# Altium project Control V3.PrjPcb
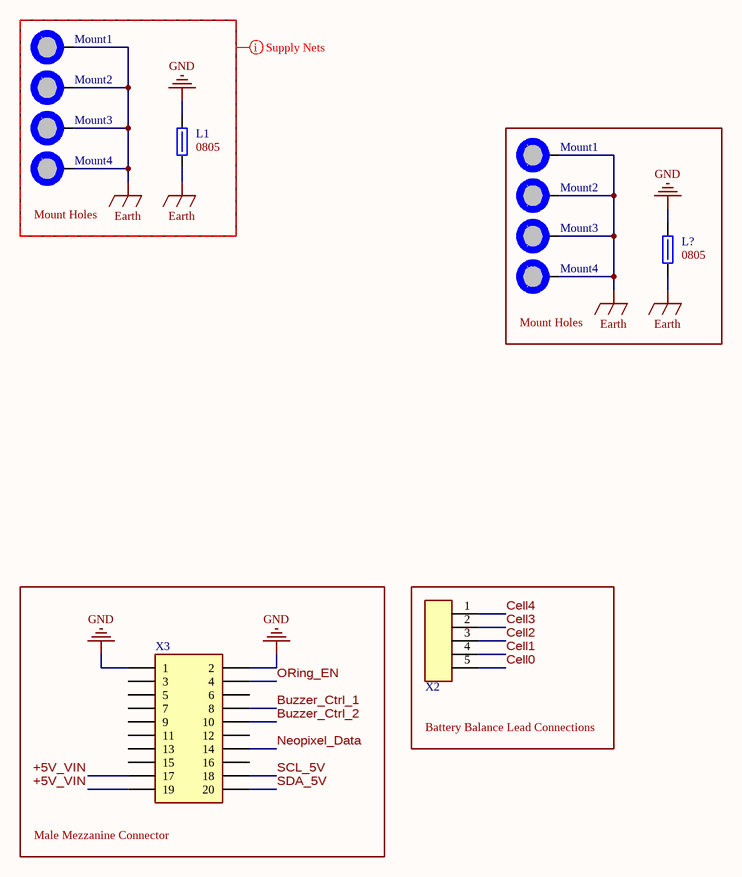
[diagram p0: Connections.SchDoc]
4 sheets, 85 parts. Net scope: global (net labels, ports and power ports of the same name join across sheets).
Board file: Layout.PcbDoc
Sheets:
  Connections.SchDoc
  RP2350.SchDoc
  Power.SchDoc
  Battery Monitor.SchDoc

## Sheet Connections.SchDoc
size A; SheetNumber: 1; SheetTotal: 4

### Parts
(Parts that share a designator on the sheet are numbered #1, #2 ... from top to bottom, then left to right.)
L1  Size Package: 0805  [[Ferrite] SMD 0805]  (hidden comment: 652-MH2029-300Y)
L?  Size Package: 0805  [[Ferrite] SMD 0805]  (hidden comment: 652-MH2029-300Y)
Mount1#1  M3 Mount Hole  [[Mount] M3 Mount Hole]  (value not drawn)  (no BOM)
Mount1#2  M3 Mount Hole  [[Mount] M3 Mount Hole]  (value not drawn)  (no BOM)
Mount2#1  M3 Mount Hole  [[Mount] M3 Mount Hole]  (value not drawn)  (no BOM)
Mount2#2  M3 Mount Hole  [[Mount] M3 Mount Hole]  (value not drawn)  (no BOM)
Mount3#1  M3 Mount Hole  [[Mount] M3 Mount Hole]  (value not drawn)  (no BOM)
Mount3#2  M3 Mount Hole  [[Mount] M3 Mount Hole]  (value not drawn)  (no BOM)
Mount4#1  M3 Mount Hole  [[Mount] M3 Mount Hole]  (value not drawn)  (no BOM)
Mount4#2  M3 Mount Hole  [[Mount] M3 Mount Hole]  (value not drawn)  (no BOM)
X2  [JST] 5pin 90deg 2.54mm pitch  [[JST] 5pin 90deg 2.54mm pitch]  (value not drawn)
X3  [Mezzanine] 20pin H=3.5mm Male  [[Mezzanine] 20pin H=3.5mm Male]  (value not drawn)

### Blocks framed on the sheet
Mount Holes: L1 Mount1#1 Mount2#1 Mount3#1 Mount4#1
Mount Holes: L? Mount1#2 Mount2#2 Mount3#2 Mount4#2
Male Mezzanine Connector: X3
Battery Balance Lead Connections: X2

### Nets
Earth: L1.1 L?.1 Mount1#1.1 Mount1#2.1 Mount2#1.1 Mount2#2.1 Mount3#1.1 Mount3#2.1 Mount4#1.1 Mount4#2.1
GND: L1.2 L?.2 X3.1 X3.2
+5V_VIN: X3.17 X3.19
Buzzer_Ctrl_1: X3.8
Buzzer_Ctrl_2: X3.10
Cell0: X2.5
Cell1: X2.4
Cell2: X2.3
Cell3: X2.2
Cell4: X2.1
Neopixel_Data: X3.14
ORing_EN: X3.4
SCL_5V: X3.18
SDA_5V: X3.20

Not connected (* = marked no-connect by the designer): X3 3 5 6 7 9 11 12 13 15 16

### Layout directives
net class Supply_Nets: Earth, GND

### Notes on the sheet
- (in symbol [Lug] 2pin M3 35A) M3; 35A

### Library data of the parts
L1 L? = [Ferrite] SMD 0805 3A 30ohm: Res @ Freq: 30 @ 100MHz; Supplier 1: DigiKey; Supplier Part Number 1: MH2029-300YCT-ND
Mount1#1 Mount1#2 Mount2#1 Mount2#2 Mount3#1 Mount3#2 Mount4#1 Mount4#2 = [Mount] M3 Mount Hole: Place at least 4.5mm from board edge. Plated.
X3 = [Mezzanine] 20pin H=3.5mm Male: DF40HC(3.5)-20DS-0.4V(51); System: Connector; Supplier 1: DigiKey; Supplier Part Number 1: 26-DF40HC(3.5)-20DS-0.4V(51)CT-ND

## Sheet RP2350.SchDoc
size B; SheetNumber: 2; SheetTotal: 4
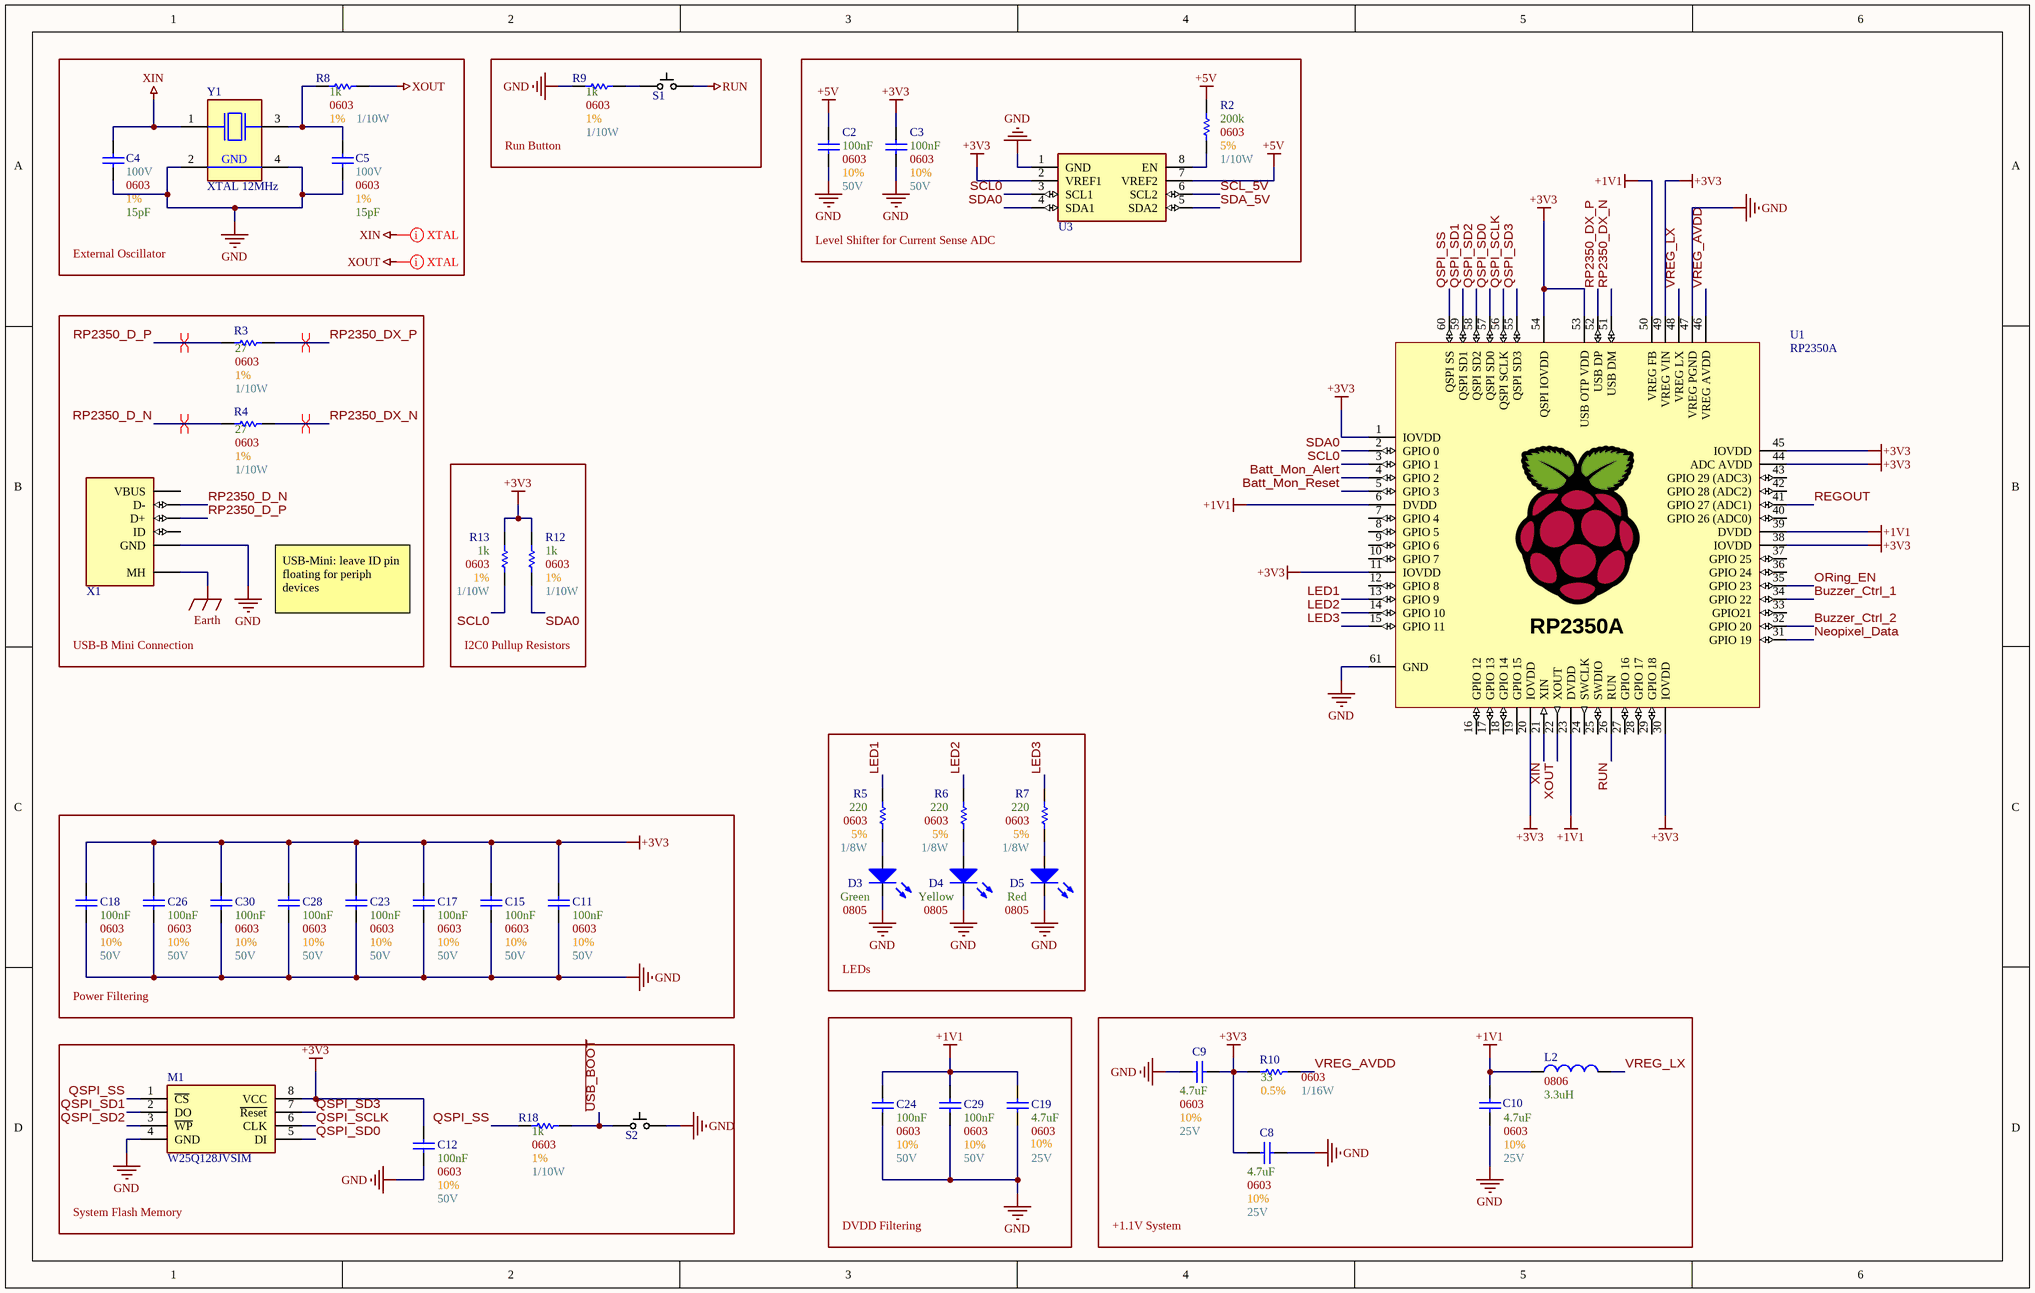
[diagram p1: RP2350.SchDoc]

### Parts
C2  Max Voltage: 50V  Size Package: 0603  Tolerance: 10%  Capacitance: 100nF  [[Cap] SMD 0603]  (hidden comment: [Cap] 0603 0.1uF 10% 50V)
C3  Max Voltage: 50V  Size Package: 0603  Tolerance: 10%  Capacitance: 100nF  [[Cap] SMD 0603]  (hidden comment: [Cap] 0603 0.1uF 10% 50V)
C4  Max Voltage: 100V  Size Package: 0603  Tolerance: 1%  Capacitance: 15pF  [[Cap] SMD 0603]  (hidden comment: [Cap] 0603 15pF 1% 100V)
C5  Max Voltage: 100V  Size Package: 0603  Tolerance: 1%  Capacitance: 15pF  [[Cap] SMD 0603]  (hidden comment: [Cap] 0603 15pF 1% 100V)
C8  Max Voltage: 25V  Size Package: 0603  Tolerance: 10%  Capacitance: 4.7uF  [[Cap] SMD 0603]  (hidden comment: [Cap] 0603 4.7uF 10% 25V)
C9  Max Voltage: 25V  Size Package: 0603  Tolerance: 10%  Capacitance: 4.7uF  [[Cap] SMD 0603]  (hidden comment: [Cap] 0603 4.7uF 10% 25V)
C10  Max Voltage: 25V  Size Package: 0603  Tolerance: 10%  Capacitance: 4.7uF  [[Cap] SMD 0603]  (hidden comment: [Cap] 0603 4.7uF 10% 25V)
C11  Max Voltage: 50V  Size Package: 0603  Tolerance: 10%  Capacitance: 100nF  [[Cap] SMD 0603]  (hidden comment: [Cap] 0603 0.1uF 10% 50V)
C12  Max Voltage: 50V  Size Package: 0603  Tolerance: 10%  Capacitance: 100nF  [[Cap] SMD 0603]  (hidden comment: [Cap] 0603 0.1uF 10% 50V)
C15  Max Voltage: 50V  Size Package: 0603  Tolerance: 10%  Capacitance: 100nF  [[Cap] SMD 0603]  (hidden comment: [Cap] 0603 0.1uF 10% 50V)
C17  Max Voltage: 50V  Size Package: 0603  Tolerance: 10%  Capacitance: 100nF  [[Cap] SMD 0603]  (hidden comment: [Cap] 0603 0.1uF 10% 50V)
C18  Max Voltage: 50V  Size Package: 0603  Tolerance: 10%  Capacitance: 100nF  [[Cap] SMD 0603]  (hidden comment: [Cap] 0603 0.1uF 10% 50V)
C19  Max Voltage: 25V  Size Package: 0603  Tolerance: 10%  Capacitance: 4.7uF  [[Cap] SMD 0603]  (hidden comment: [Cap] 0603 4.7uF 10% 25V)
C23  Max Voltage: 50V  Size Package: 0603  Tolerance: 10%  Capacitance: 100nF  [[Cap] SMD 0603]  (hidden comment: [Cap] 0603 0.1uF 10% 50V)
C24  Max Voltage: 50V  Size Package: 0603  Tolerance: 10%  Capacitance: 100nF  [[Cap] SMD 0603]  (hidden comment: [Cap] 0603 0.1uF 10% 50V)
C26  Max Voltage: 50V  Size Package: 0603  Tolerance: 10%  Capacitance: 100nF  [[Cap] SMD 0603]  (hidden comment: [Cap] 0603 0.1uF 10% 50V)
C28  Max Voltage: 50V  Size Package: 0603  Tolerance: 10%  Capacitance: 100nF  [[Cap] SMD 0603]  (hidden comment: [Cap] 0603 0.1uF 10% 50V)
C29  Max Voltage: 50V  Size Package: 0603  Tolerance: 10%  Capacitance: 100nF  [[Cap] SMD 0603]  (hidden comment: [Cap] 0603 0.1uF 10% 50V)
C30  Max Voltage: 50V  Size Package: 0603  Tolerance: 10%  Capacitance: 100nF  [[Cap] SMD 0603]  (hidden comment: [Cap] 0603 0.1uF 10% 50V)
D3  Color: Green  Size Package: 0805  [[LED] SMD 0805]  (hidden comment: [LED] SMD 0805 Green)
D4  Color: Yellow  Size Package: 0805  [[LED] SMD 0805]  (hidden comment: [LED] SMD 0805 Yellow)
D5  Color: Red  Size Package: 0805  [[LED] SMD 0805]  (hidden comment: [LED] SMD 0805 Red)
L2  Package: 0806  Inductance: 3.3uH  [[Inductor] SMD 0806]  (hidden comment: [3.3uH] SMD 0806 2.1A)
M1  W25Q128JVSIM  [[Flash] 128MBit]
R2  Wattage: 1/10W  Tolerance: 5%  Resistance: 200k  Size Package: 0603  [[Res] SMD 0603]  (hidden comment: [200k] SMD 0603 1% 1/10W)
R3  Wattage: 1/10W  Tolerance: 1%  Resistance: 27  Size Package: 0603  [[Res] SMD 0603]  (hidden comment: [27] SMD 0603 1% 1/10W)
R4  Wattage: 1/10W  Tolerance: 1%  Resistance: 27  Size Package: 0603  [[Res] SMD 0603]  (hidden comment: [27] SMD 0603 1% 1/10W)
R5  Wattage: 1/8W  Tolerance: 5%  Resistance: 220  Size Package: 0603  [[Res] SMD 0603]  (hidden comment: [220] SMD 0603 5% 1/10W)
R6  Wattage: 1/8W  Tolerance: 5%  Resistance: 220  Size Package: 0603  [[Res] SMD 0603]  (hidden comment: [220] SMD 0603 5% 1/10W)
R7  Wattage: 1/8W  Tolerance: 5%  Resistance: 220  Size Package: 0603  [[Res] SMD 0603]  (hidden comment: [220] SMD 0603 5% 1/10W)
R8  Wattage: 1/10W  Tolerance: 1%  Resistance: 1k  Size Package: 0603  [[Res] SMD 0603]  (hidden comment: [1k] SMD 0603 1% 1/10W)
R9  Wattage: 1/10W  Tolerance: 1%  Resistance: 1k  Size Package: 0603  [[Res] SMD 0603]  (hidden comment: [1k] SMD 0603 1% 1/10W)
R10  Wattage: 1/16W  Tolerance: 0.5%  Resistance: 33  Size Package: 0603  [[Res] SMD 0603]  (hidden comment: [33] SMD 0603 0.5% 1/16W)
R12  Wattage: 1/10W  Tolerance: 1%  Resistance: 1k  Size Package: 0603  [[Res] SMD 0603]  (hidden comment: [1k] SMD 0603 1% 1/10W)
R13  Wattage: 1/10W  Tolerance: 1%  Resistance: 1k  Size Package: 0603  [[Res] SMD 0603]  (hidden comment: [1k] SMD 0603 1% 1/10W)
R18  Wattage: 1/10W  Tolerance: 1%  Resistance: 1k  Size Package: 0603  [[Res] SMD 0603]  (hidden comment: [1k] SMD 0603 1% 1/10W)
S1  [SPST] SMD Pushbutton  [[SPST] SMD Pushbutton]  (value not drawn)
S2  [SPST] SMD Pushbutton  [[SPST] SMD Pushbutton]  (value not drawn)
U1  RP2350A  [[MCU] RP2350A]
U3  [Level Shifter] I2C Level Shifter  [[Level Shifter] I2C Level Shifter]  (value not drawn)
X1  [USB] Type-B Mini  [[USB] Type-B Mini]  (value not drawn)
Y1  XTAL 12MHz  [[Crystal] SMD 12MHz]

### Blocks framed on the sheet
External Oscillator: C4 C5 R8 Y1
Run Button: R9 S1
Level Shifter for Current Sense ADC: C2 C3 R2 U3
USB-B Mini Connection: R3 R4 X1
I2C0 Pullup Resistors: R12 R13
LEDs: D3-D5 R5-R7
Power Filtering: C11 C15 C17 C18 C23 C26 C28 C30
DVDD Filtering: C19 C24 C29
+1.1V System: C8-C10 L2 R10
System Flash Memory: C12 M1 R18 S2

### Nets
+1V1: C10.1 C19.2 C24.2 C29.2 L2.1 U1.6(DVDD) U1.23(DVDD) U1.39(DVDD) U1.50(VREG_FB)
+3V3: C3.2 C8.2 C9.1 C11.2 C12.2 C15.2 C17.2 C18.2 C23.2 C26.2 C28.2 C30.2 M1.8(VCC) R10.1 R12.2 R13.2 U1.1(IOVDD) U1.11(IOVDD) U1.20(IOVDD) U1.30(IOVDD) U1.38(IOVDD) U1.44(ADC_AVDD) U1.45(IOVDD) U1.49(VREG_VIN) U1.53(USB_OTP_VDD) U1.54(QSPI_IOVDD) U3.2(VREF1)
+5V: C2.2 R2.2 U3.7(VREF2)
Earth: X1.MH
GND: C2.1 C3.1 C4.1 C5.1 C8.1 C9.2 C10.2 C11.1 C12.1 C15.1 C17.1 C18.1 C19.1 C23.1 C24.1 C26.1 C28.1 C29.1 C30.1 D3.2(Cathode) D4.2(Cathode) D5.2(Cathode) M1.4(GND) R9.1 S2.2 U1.47(VREG_PGND) U1.61(GND) U3.1(GND) X1.5(GND) Y1.2(GND) Y1.4(GND)
RUN: S1.2 U1.26(RUN)
XIN: C4.2 U1.21(XIN) Y1.1(XTAL1)
XOUT: R8.2 U1.22(XOUT)
Batt_Mon_Alert: U1.4(GPIO_2)
Batt_Mon_Reset: U1.5(GPIO_3)
Buzzer_Ctrl_1: U1.34(GPIO_22)
Buzzer_Ctrl_2: U1.32(GPIO_20)
LED1: R5.2 U1.13(GPIO_9)
LED2: R6.2 U1.14(GPIO_10)
LED3: R7.2 U1.15(GPIO_11)
Neopixel_Data: U1.31(GPIO_19)
ORing_EN: U1.35(GPIO_23)
QSPI_SCLK: M1.6(CLK) U1.56(QSPI_SCLK)
QSPI_SD0: M1.5(DI) U1.57(QSPI_SD0)
QSPI_SD1: M1.2(DO) U1.59(QSPI_SD1)
QSPI_SD2: M1.3(~{WP}) U1.58(QSPI_SD2)
QSPI_SD3: M1.7(~{Reset}) U1.55(QSPI_SD3)
QSPI_SS: M1.1(~{CS}) R18.1 U1.60(QSPI_SS)
REGOUT: U1.41(GPIO_27_(ADC1))
RP2350_D_N: R4.1 X1.2(D-)
RP2350_D_P: R3.1 X1.3(D+)
RP2350_DX_N: R4.2 U1.51(USB_DM)
RP2350_DX_P: R3.2 U1.52(USB_DP)
SCL0: R13.1 U1.3(GPIO_1) U3.3(SCL1)
SCL_5V: U3.6(SCL2)
SDA0: R12.1 U1.2(GPIO_0) U3.4(SDA1)
SDA_5V: U3.5(SDA2)
~{USB_BOOT}: R18.2 S2.1
VREG_AVDD: R10.2 U1.46(VREG_AVDD)
VREG_LX: L2.2 U1.48(VREG_LX)
NetC5_2: C5.2 R8.1 Y1.3(XTAL2)
NetD3_1: D3.1(Anode) R5.1
NetD4_1: D4.1(Anode) R6.1
NetD5_1: D5.1(Anode) R7.1
NetR2_1: R2.1 U3.8(EN)
NetR9_2: R9.2 S1.1

Not connected (* = marked no-connect by the designer): U1 7(GPIO_4) 8(GPIO_5) 9(GPIO_6) 10(GPIO_7) 12(GPIO_8) 16(GPIO_12) 17(GPIO_13) 18(GPIO_14) 19(GPIO_15) 24(SWCLK) 25(SWDIO) 27(GPIO_16) 28(GPIO_17) 29(GPIO_18) 33(GPIO21) 36(GPIO_24) 37(GPIO_25) 40(GPIO_26_(ADC0)) 42(GPIO_28_(ADC2)) 43(GPIO_29_(ADC3)); X1 1(VBUS) 4(ID)

### Layout directives
differential pair; differential pair class USB_Pairs: RP2350_D_N, RP2350_D_P, RP2350_DX_N, RP2350_DX_P
net class XTAL_Nets: XIN, XOUT

### Notes on the sheet
- USB-Mini: leave ID pin floating for periph devices
- Labels drawn without touching a wire or pin: XIN, XOUT

### Library data of the parts
C2 C3 C11 C12 C15 C17 C18 C23 C24 C26 C28-C30 = [Cap] 0603 0.1uF 10% 50V: CL10B104KB8NNNC; Supplier 1: DigiKey; Supplier Part Number 1: 1276-1000-6-ND
C4 C5 = [Cap] 0603 15pF 1% 100V: GCM1885C2A150FA16D; Supplier 1: DigiKey; Supplier Part Number 1: 490-16416-1-ND
C8-C10 C19 = [Cap] 0603 4.7uF 10% 25V: GRM188R61E475KE11D; Supplier 1: DigiKey; Supplier Part Number 1: 490-7203-6-ND
D3 = [LED] SMD 0805 Green: LG R971-KN-1-0-20-R18; Supplier 1: DigiKey; Supplier Part Number 1: 475-LGR971-KN-1CT-ND
D4 = [LED] SMD 0805 Yellow: LY R976-PS-36-0-20-R18; Supplier 1: DigiKey; Supplier Part Number 1: 475-LYR976-PS-36-0-20-R18CT-ND
D5 = [LED] SMD 0805 Red: LS R976-NR-1-0-20-R18; Supplier 1: DigiKey; Supplier Part Number 1: 475-LSR976-NR-1CT-ND
L2 = [3.3uH] SMD 0806 2.1A: AOTA-B201610S3R3-101-T; Supplier 1: DigiKey; Supplier Part Number 1: 535-AOTA-B201610S3R3-101-TCT-ND
M1 = [Flash] 128MBit: Supplier 1: DigiKey; Supplier Part Number 1: W25Q128JVSIM-ND
R2 = [200k] SMD 0603 1% 1/10W: RC0603JR-07200KL; Supplier 1: DigiKey; Supplier Part Number 1: 311-200KGRCT-ND
R3 R4 = [27] SMD 0603 1% 1/10W: MCT06030C2709FP500; Supplier 1: DigiKey; Supplier Part Number 1: 749-1631-1-ND
R5-R7 = [220] SMD 0603 5% 1/10W: RK73B1JTTD221J; Supplier 1: DigiKey; Supplier Part Number 1: 2019-RK73B1JTTD221JDKR-ND
R8 R9 R12 R13 R18 = [1k] SMD 0603 1% 1/10W: RMCF0603FT1K00; Supplier 1: DigiKey; Supplier Part Number 1: RMCF0603FT1K00DKR-ND
R10 = [33] SMD 0603 0.5% 1/16W: RR0816Q-330-D; Supplier 1: DigiKey; Supplier Part Number 1: RR08Q33DDKR-ND
S1 S2 = [SPST] SMD Pushbutton: PTS815SJM250SMTRLFS; Supplier 1: DigiKey; Supplier Part Number 1: CKN12215-6-ND
U1 = [MCU] RP2350A: QFN-60 Package; Supplier 1: DigiKey; Supplier Part Number 1: 2648-SC1509-A4CT-ND
U3 = [Level Shifter] I2C Level Shifter: PCA9306DCTR; Supplier 1: DigiKey; Supplier Part Number 1: 296-18509-1-ND
X1 = [USB] Type-B Mini: MUSB-05-S-B-SM-A-K-TR; Supplier 1: DigiKey; Supplier Part Number 1: SAM14226CT-ND
Y1 = [Crystal] SMD 12MHz: 815-ABM8-272-T3; Supplier 1: DigiKey; Supplier Part Number 1: 535-ABM8-272-T3CT-ND

## Sheet Power.SchDoc
size A; SheetNumber: 3; SheetTotal: 4
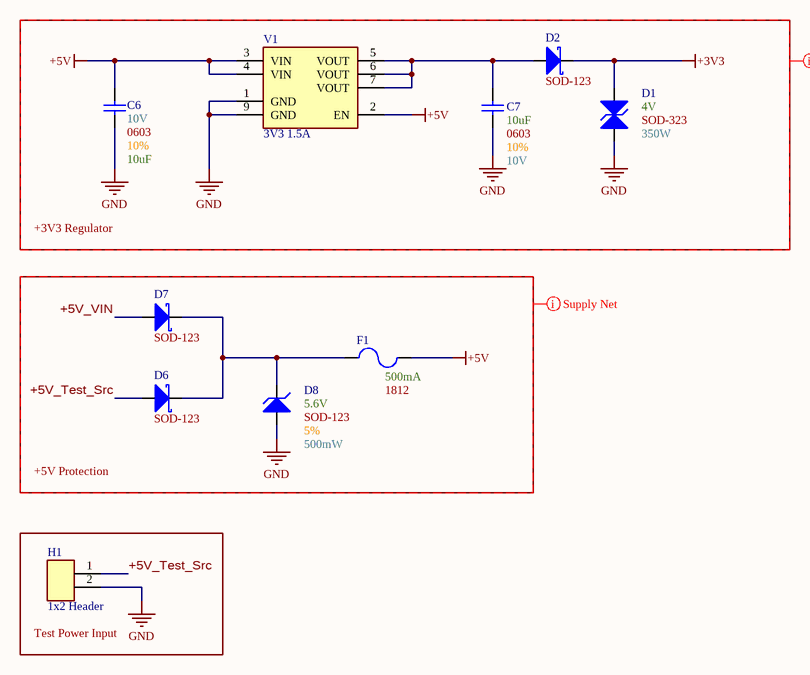
[diagram p2: Power.SchDoc]

### Parts
C6  Max Voltage: 10V  Size Package: 0603  Tolerance: 10%  Capacitance: 10uF  [[Cap] SMD 0603]  (hidden comment: [Cap] 0603 10uF 10% 10V)
C7  Max Voltage: 10V  Size Package: 0603  Tolerance: 10%  Capacitance: 10uF  [[Cap] SMD 0603]  (hidden comment: [Cap] 0603 10uF 10% 10V)
D1  Wattage: 350W  Optimal Zener Voltage: 4V  [[Diode] SOD-323]  (hidden comment: SOD-323)
D2  Footprint: SOD-123  [[Diode] SMD SOD-123]  (hidden comment: SOD123)
D6  Footprint: SOD-123  [[Diode] SMD SOD-123]  (hidden comment: SOD123)
D7  Footprint: SOD-123  [[Diode] SMD SOD-123]  (hidden comment: SOD123)
D8  Tolerance: 5%  Wattage: 500mW  Optimal Zener Voltage: 5.6V  [[Diode] SMD SOD-123]  (hidden comment: SOD-123)
F1  Size Package: 1812  Trip Current: 500mA  [[PTC] SMD 1812]  (hidden comment: [PTC] SMD 1812 500mA)
H1  1x2 Header  [[Header] 1x2 Male]
V1  3V3 1.5A  [[Linear] 3V3 1.5A]

### Blocks framed on the sheet
+3V3 Regulator: C6 C7 D1 D2 V1
+5V Protection: D6-D8 F1
Test Power Input: H1

### Nets
+3V3: D1.1(K) D2.1(K)
+5V: C6.2 F1.2 V1.2(EN) V1.3(VIN) V1.4(VIN)
GND: C6.1 C7.1 D1.2(A) D8.2(A) H1.2 V1.1(GND) V1.9(GND)
+5V_Test_Src: D6.2(A) H1.1
+5V_VIN: D7.2(A)
NetC7_2: C7.2 D2.2(A) V1.5(VOUT) V1.6(VOUT) V1.7(VOUT)
NetD6_1: D6.1(K) D7.1(K) D8.1(K) F1.1

### Layout directives
net class Supply_Nets: +3V3, +5V, +5V_Test_Src, +5V_VIN, GND

### Notes on the sheet
- (in symbol [Switching] SMD 0.8-10V Adjustable) VIN; VOUT; GNDs; CONFIG

### Library data of the parts
C6 C7 = [Cap] 0603 10uF 10% 10V: CL10A106KP8NNNC; Supplier 1: DigiKey; Supplier Part Number 1: 1276-1192-6-ND
D1 = [TVS] 3.3Vnom 19Vclamp_max: CDSOD323-T03C; Supplier 1: DigiKey; Footprint: SOD-323; Supplier Part Number 1: CDSOD323-T03CDKR-ND
D2 D6 D7 = [Schottky] SMD 40V 1A: B5819W-TP; Supplier 1: DigiKey; Supplier Part Number 1: B5819W-TPMSCT-ND
D8 = [Zener] SMD 5.6V 1/2W 5%: CMHZ5232B TR PBFREE; Supplier 1: DigiKey; Footprint: SOD-123; Supplier Part Number 1: 1514-CMHZ5232BTRPBFREEDKR-ND
F1 = [PTC] SMD 1812 500mA: MF-MSMF050-2; Supplier 1: DigiKey; Supplier Part Number 1: MF-MSMF050-2DKR-ND
H1 = [Header] 1x2 Male: 2.54mm pitch
V1 = [Linear] 3V3 1.5A: AP7362A-33SP-13; Supplier 1: DigiKey; Supplier Part Number 1: AP7362A-33SP-13DICT-ND

## Sheet Battery Monitor.SchDoc
size A; SheetNumber: 4; SheetTotal: 4
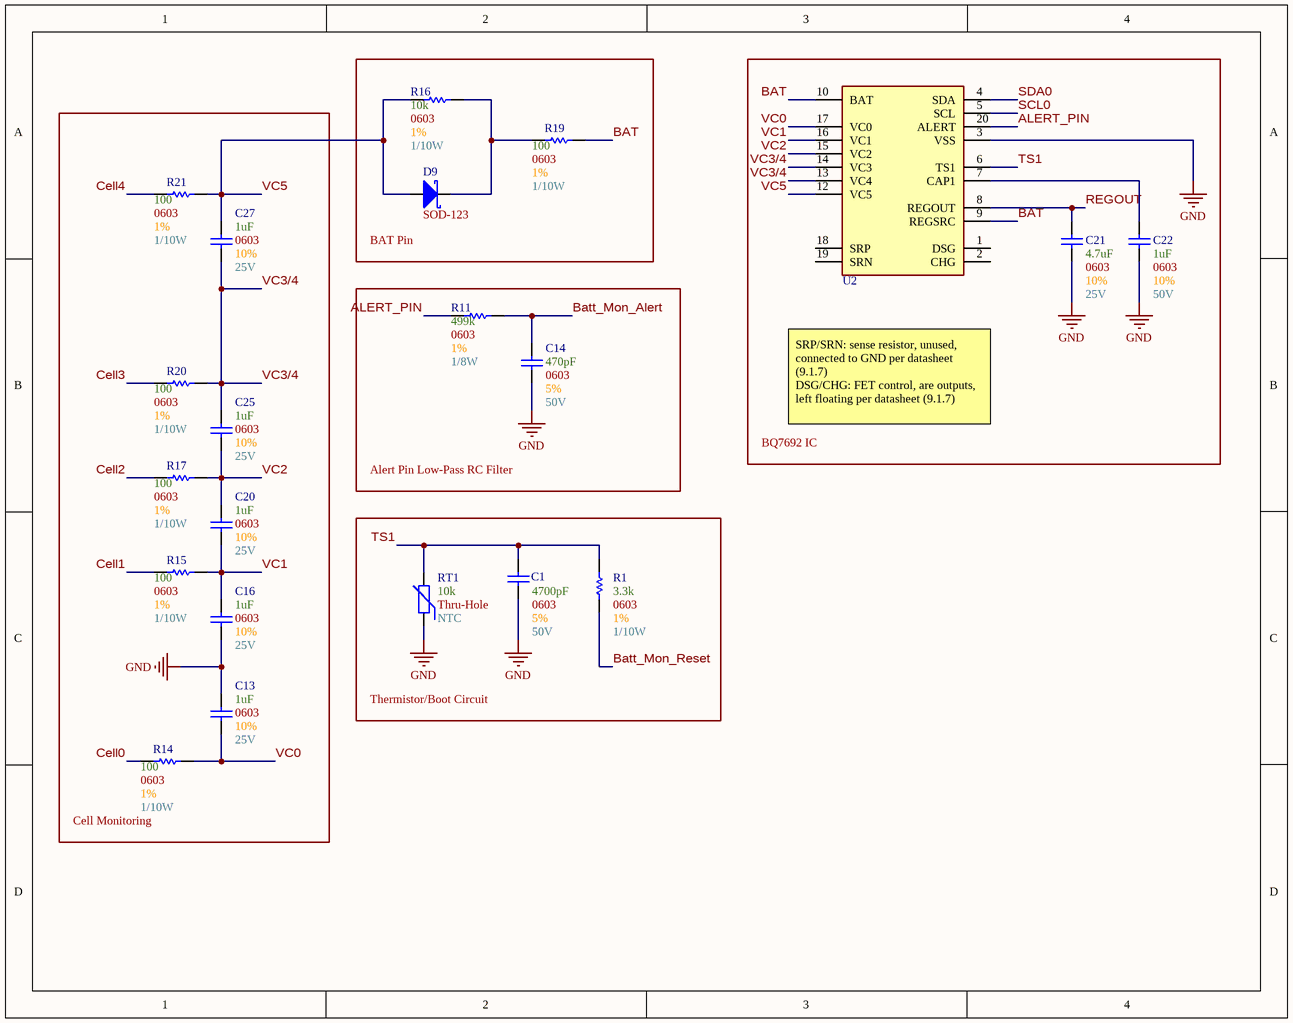
[diagram p3: Battery Monitor.SchDoc]

### Parts
C1  Max Voltage: 50V  Size Package: 0603  Tolerance: 5%  Capacitance: 4700pF  [[Cap] SMD 0603]  (hidden comment: [Cap] 0603 4700pF 5% 50V)
C13  Max Voltage: 25V  Size Package: 0603  Tolerance: 10%  Capacitance: 1uF  [[Cap] SMD 0603]  (hidden comment: [Cap] 0603 1uF 10% 25V)
C14  Max Voltage: 50V  Size Package: 0603  Tolerance: 5%  Capacitance: 470pF  [[Cap] SMD 0603]  (hidden comment: [Cap] 0603 470pF 5% 50V)
C16  Max Voltage: 25V  Size Package: 0603  Tolerance: 10%  Capacitance: 1uF  [[Cap] SMD 0603]  (hidden comment: [Cap] 0603 1uF 10% 25V)
C20  Max Voltage: 25V  Size Package: 0603  Tolerance: 10%  Capacitance: 1uF  [[Cap] SMD 0603]  (hidden comment: [Cap] 0603 1uF 10% 25V)
C21  Max Voltage: 25V  Size Package: 0603  Tolerance: 10%  Capacitance: 4.7uF  [[Cap] SMD 0603]  (hidden comment: [Cap] 0603 4.7uF 10% 25V)
C22  Max Voltage: 50V  Size Package: 0603  Tolerance: 10%  Capacitance: 1uF  [[Cap] SMD 0603]  (hidden comment: [Cap] 0603 1uF 10% 50V)
C25  Max Voltage: 25V  Size Package: 0603  Tolerance: 10%  Capacitance: 1uF  [[Cap] SMD 0603]  (hidden comment: [Cap] 0603 1uF 10% 25V)
C27  Max Voltage: 25V  Size Package: 0603  Tolerance: 10%  Capacitance: 1uF  [[Cap] SMD 0603]  (hidden comment: [Cap] 0603 1uF 10% 25V)
D9  Footprint: SOD-123  [[Diode] SMD SOD-123]  (hidden comment: SOD123)
R1  Wattage: 1/10W  Tolerance: 1%  Resistance: 3.3k  Size Package: 0603  [[Res] SMD 0603]  (hidden comment: [3.3k] SMD 0603 1% 1/10W)
R11  Wattage: 1/8W  Tolerance: 1%  Resistance: 499k  Size Package: 0603  [[Res] SMD 0603]  (hidden comment: [499k] SMD 0603 1% 1/8W)
R14  Wattage: 1/10W  Tolerance: 1%  Resistance: 100  Size Package: 0603  [[Res] SMD 0603]  (hidden comment: [100] SMD 0603 1% 1/10W)
R15  Wattage: 1/10W  Tolerance: 1%  Resistance: 100  Size Package: 0603  [[Res] SMD 0603]  (hidden comment: [100] SMD 0603 1% 1/10W)
R16  Wattage: 1/10W  Tolerance: 1%  Resistance: 10k  Size Package: 0603  [[Res] SMD 0603]  (hidden comment: [10k] SMD 0603 1% 1/8W)
R17  Wattage: 1/10W  Tolerance: 1%  Resistance: 100  Size Package: 0603  [[Res] SMD 0603]  (hidden comment: [100] SMD 0603 1% 1/10W)
R19  Wattage: 1/10W  Tolerance: 1%  Resistance: 100  Size Package: 0603  [[Res] SMD 0603]  (hidden comment: [100] SMD 0603 1% 1/10W)
R20  Wattage: 1/10W  Tolerance: 1%  Resistance: 100  Size Package: 0603  [[Res] SMD 0603]  (hidden comment: [100] SMD 0603 1% 1/10W)
R21  Wattage: 1/10W  Tolerance: 1%  Resistance: 100  Size Package: 0603  [[Res] SMD 0603]  (hidden comment: [100] SMD 0603 1% 1/10W)
RT1  Mounting Style: Thru-Hole  Technology: NTC  Res at 25degC: 10k  [[NTC] 10k Thru-Hole 5mm Pitch]  (hidden comment: [NTC] 10k Thru-Hole 5mm Pitch)
U2  [Batt Mon] 3-5 Cell BMS  [[Batt Mon] 3-5 Cell BMS]  (value not drawn)

### Blocks framed on the sheet
BAT Pin: D9 R16 R19
BQ7692 IC: C21 C22 U2
Cell Monitoring: C13 C16 C20 C25 C27 R14 R15 R17 R20 R21
Alert Pin Low-Pass RC Filter: C14 R11
Thermistor/Boot Circuit: C1 R1 RT1

### Nets
GND: C1.1 C13.2 C14.1 C16.1 C21.1 C22.1 RT1.1 U2.3(VSS)
ALERT_PIN: R11.1 U2.20(ALERT)
BAT: R19.2 U2.9(REGSRC) U2.10(BAT)
Batt_Mon_Alert: C14.2 R11.2
Batt_Mon_Reset: R1.1
Cell0: R14.1
Cell1: R15.1
Cell2: R17.1
Cell3: R20.1
Cell4: R21.1
REGOUT: C21.2 U2.8(REGOUT)
SCL0: U2.5(SCL)
SDA0: U2.4(SDA)
TS1: C1.2 R1.2 RT1.2 U2.6(TS1)
VC0: C13.1 R14.2 U2.17(VC0)
VC1: C16.2 C20.1 R15.2 U2.16(VC1)
VC2: C20.2 C25.1 R17.2 U2.15(VC2)
VC3/4: C25.2 C27.1 R20.2 U2.13(VC4) U2.14(VC3)
VC5: C27.2 D9.2(A) R16.2 R21.2 U2.12(VC5)
NetC22_2: C22.2 U2.7(CAP1)
NetD9_1: D9.1(K) R16.1 R19.1

Not connected (* = marked no-connect by the designer): U2 1(DSG) 2(CHG) 18(SRP) 19(SRN)

### Notes on the sheet
- SRP/SRN: sense resistor, unused, connected to GND per datasheet (9.1.7)
  DSG/CHG: FET control, are outputs, left floating per datasheet (9.1.7)

### Library data of the parts
C1 = [Cap] 0603 4700pF 5% 50V: GRM1885C1H472JA01D; Supplier 1: DigiKey; Supplier Part Number 1: 490-9669-6-ND
C13 C16 C20 C25 C27 = [Cap] 0603 1uF 10% 25V: CL10B105KA8NNNC; Supplier 1: DigiKey; Supplier Part Number 1: 1276-1184-1-ND
C14 = [Cap] 0603 470pF 5% 50V: C0603C471J5GACTU; Supplier 1: DigiKey; Supplier Part Number 1: 399-C0603C471J5GACTUDKR-ND
C21 = [Cap] 0603 4.7uF 10% 25V: GRM188R61E475KE11D; Supplier 1: DigiKey; Supplier Part Number 1: 490-7203-6-ND
C22 = [Cap] 0603 1uF 10% 50V: UMK107AB7105KA-T; Supplier 1: DigiKey; Supplier Part Number 1: 587-3247-1-ND
D9 = [Schottky] SMD 40V 1A: B5819W-TP; Supplier 1: DigiKey; Supplier Part Number 1: B5819W-TPMSCT-ND
R1 = [3.3k] SMD 0603 1% 1/10W: RC0603FR-073K3L; Supplier 1: DigiKey; Supplier Part Number 1: 311-3.30KHRCT-ND
R11 = [499k] SMD 0603 1% 1/8W: CRCW0603499KFKEA; Supplier 1: DigiKey; Supplier Part Number 1: 541-499KHCT-ND
R14 R15 R17 R19-R21 = [100] SMD 0603 1% 1/10W: RC0603FR-07100RL; Supplier 1: DigiKey; Supplier Part Number 1: 311-100HRDKR-ND
R16 = [10k] SMD 0603 1% 1/8W: RMCF0603FT10K0; Supplier 1: DigiKey; Supplier Part Number 1: RMCF0603FT10K0DKR-ND
RT1 = [NTC] 10k Thru-Hole 5mm Pitch: B57164K0103J000; Supplier 1: DigiKey; Supplier Part Number 1: 495-2080-ND
U2 = [Batt Mon] 3-5 Cell BMS: BQ7692006PWR; Supplier 1: DigiKey; Supplier Part Number 1: 296-39960-1-ND

## Nets that join several sheets
+3V3: RP2350 (27 pins), Power (D1.1 D2.1)
+5V: RP2350 (C2.2 R2.2 U3.7), Power (5 pins)
Earth: Connections (10 pins), RP2350 (X1.MH)
GND: Connections (L1.2 L?.2 X3.1 X3.2), RP2350 (31 pins), Power (7 pins), Battery Monitor (8 pins)
+5V_VIN: Connections (X3.17 X3.19), Power (D7.2)
Batt_Mon_Alert: RP2350 (U1.4), Battery Monitor (C14.2 R11.2)
Batt_Mon_Reset: RP2350 (U1.5), Battery Monitor (R1.1)
Buzzer_Ctrl_1: Connections (X3.8), RP2350 (U1.34)
Buzzer_Ctrl_2: Connections (X3.10), RP2350 (U1.32)
Cell0: Connections (X2.5), Battery Monitor (R14.1)
Cell1: Connections (X2.4), Battery Monitor (R15.1)
Cell2: Connections (X2.3), Battery Monitor (R17.1)
Cell3: Connections (X2.2), Battery Monitor (R20.1)
Cell4: Connections (X2.1), Battery Monitor (R21.1)
Neopixel_Data: Connections (X3.14), RP2350 (U1.31)
ORing_EN: Connections (X3.4), RP2350 (U1.35)
REGOUT: RP2350 (U1.41), Battery Monitor (C21.2 U2.8)
SCL0: RP2350 (R13.1 U1.3 U3.3), Battery Monitor (U2.5)
SCL_5V: Connections (X3.18), RP2350 (U3.6)
SDA0: RP2350 (R12.1 U1.2 U3.4), Battery Monitor (U2.4)
SDA_5V: Connections (X3.20), RP2350 (U3.5)